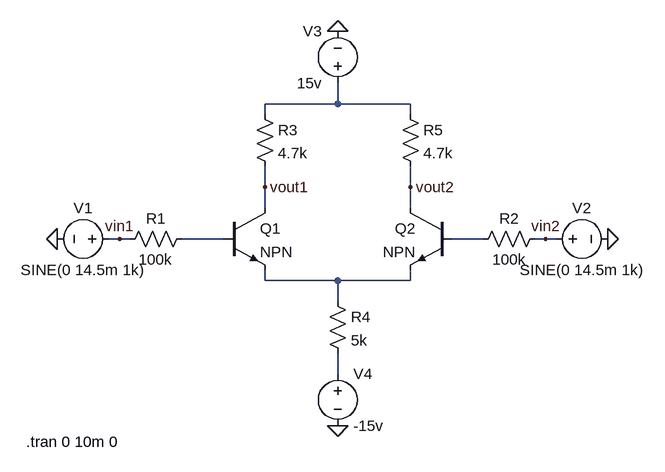
[diagram p0: schematic E4.asc]
E4.asc, the LTspice schematic file:
Version 4.1
SHEET 1 880 680
WIRE 272 -48 272 -80
WIRE 272 -48 160 -48
WIRE 384 -48 272 -48
WIRE 160 -32 160 -48
WIRE 384 -32 384 -48
WIRE 160 80 160 48
WIRE 384 80 384 48
WIRE 160 112 160 80
WIRE 384 112 384 80
WIRE -64 160 -80 160
WIRE -48 160 -64 160
WIRE 96 160 32 160
WIRE 496 160 448 160
WIRE 592 160 576 160
WIRE 608 160 592 160
WIRE 160 224 160 208
WIRE 272 224 160 224
WIRE 384 224 384 208
WIRE 384 224 272 224
WIRE 272 256 272 224
WIRE 272 368 272 336
FLAG 688 160 0
FLAG -160 160 0
FLAG 272 -160 0
FLAG 272 448 0
FLAG 160 80 vout1
FLAG 384 80 vout2
FLAG -64 160 vin1
FLAG 592 160 vin2
SYMBOL npn 96 112 R0
SYMATTR InstName Q1
SYMBOL res 48 144 R90
WINDOW 0 0 56 VBottom 2
WINDOW 3 32 56 VTop 2
SYMATTR InstName R1
SYMATTR Value 100k
SYMBOL res 592 144 R90
WINDOW 0 0 56 VBottom 2
WINDOW 3 32 56 VTop 2
SYMATTR InstName R2
SYMATTR Value 100k
SYMBOL res 144 -48 R0
SYMATTR InstName R3
SYMATTR Value 4.7k
SYMBOL res 368 -48 R0
SYMATTR InstName R5
SYMATTR Value 4.7k
SYMBOL res 256 240 R0
SYMATTR InstName R4
SYMATTR Value 5k
SYMBOL voltage -64 160 R90
WINDOW 0 -32 56 VBottom 2
WINDOW 3 32 56 VTop 2
WINDOW 123 0 0 Left 0
WINDOW 39 0 0 Left 0
SYMATTR InstName V1
SYMATTR Value SINE(0 14.5m 1k)
SYMBOL voltage 592 160 R270
WINDOW 0 32 56 VTop 2
WINDOW 3 -32 56 VBottom 2
WINDOW 123 0 0 Left 0
WINDOW 39 0 0 Left 0
SYMATTR InstName V2
SYMATTR Value SINE(0 14.5m 1k)
SYMBOL voltage 272 -64 R180
WINDOW 0 24 96 Left 2
WINDOW 3 24 16 Left 2
WINDOW 123 0 0 Left 0
WINDOW 39 0 0 Left 0
SYMATTR InstName V3
SYMATTR Value 15v
SYMBOL voltage 272 352 R0
WINDOW 123 0 0 Left 0
WINDOW 39 0 0 Left 0
SYMATTR InstName V4
SYMATTR Value -15v
SYMBOL npn 448 112 M0
SYMATTR InstName Q2
TEXT -208 472 Left 2 !.tran 0 10m 0

The netlist it stands for:
* E4.asc
Q1 vout1 N002 N004 0 NPN
R1 N002 vin1 100k
R2 vin2 N003 100k
R3 N001 vout1 4.7k
R5 N001 vout2 4.7k
R4 N004 N005 5k
V1 vin1 0 SINE(0 14.5m 1k)
V2 vin2 0 SINE(0 14.5m 1k)
V3 N001 0 15v
V4 N005 0 -15v
Q2 vout2 N003 N004 0 NPN
.model NPN NPN
.model PNP PNP
.lib standard.bjt
.tran 0 10m 0
.backanno
.end